# EasyEDA Pro project ProPrj_omb-2024-nano_2026-02-09.epro, schematic Schematic1_1
Create Date: 2024-06-04; Page Name: P1; Project Name: omb-2024-nano; Schematic Name: Schematic1_1; Update Date: 2024-06-10; Company: EasyEDA.com; Drawn: EasyEDA; Page Size: A4; Part Number: JLCPCB-002; Reviewed: EasyEDA; Version: V0.1
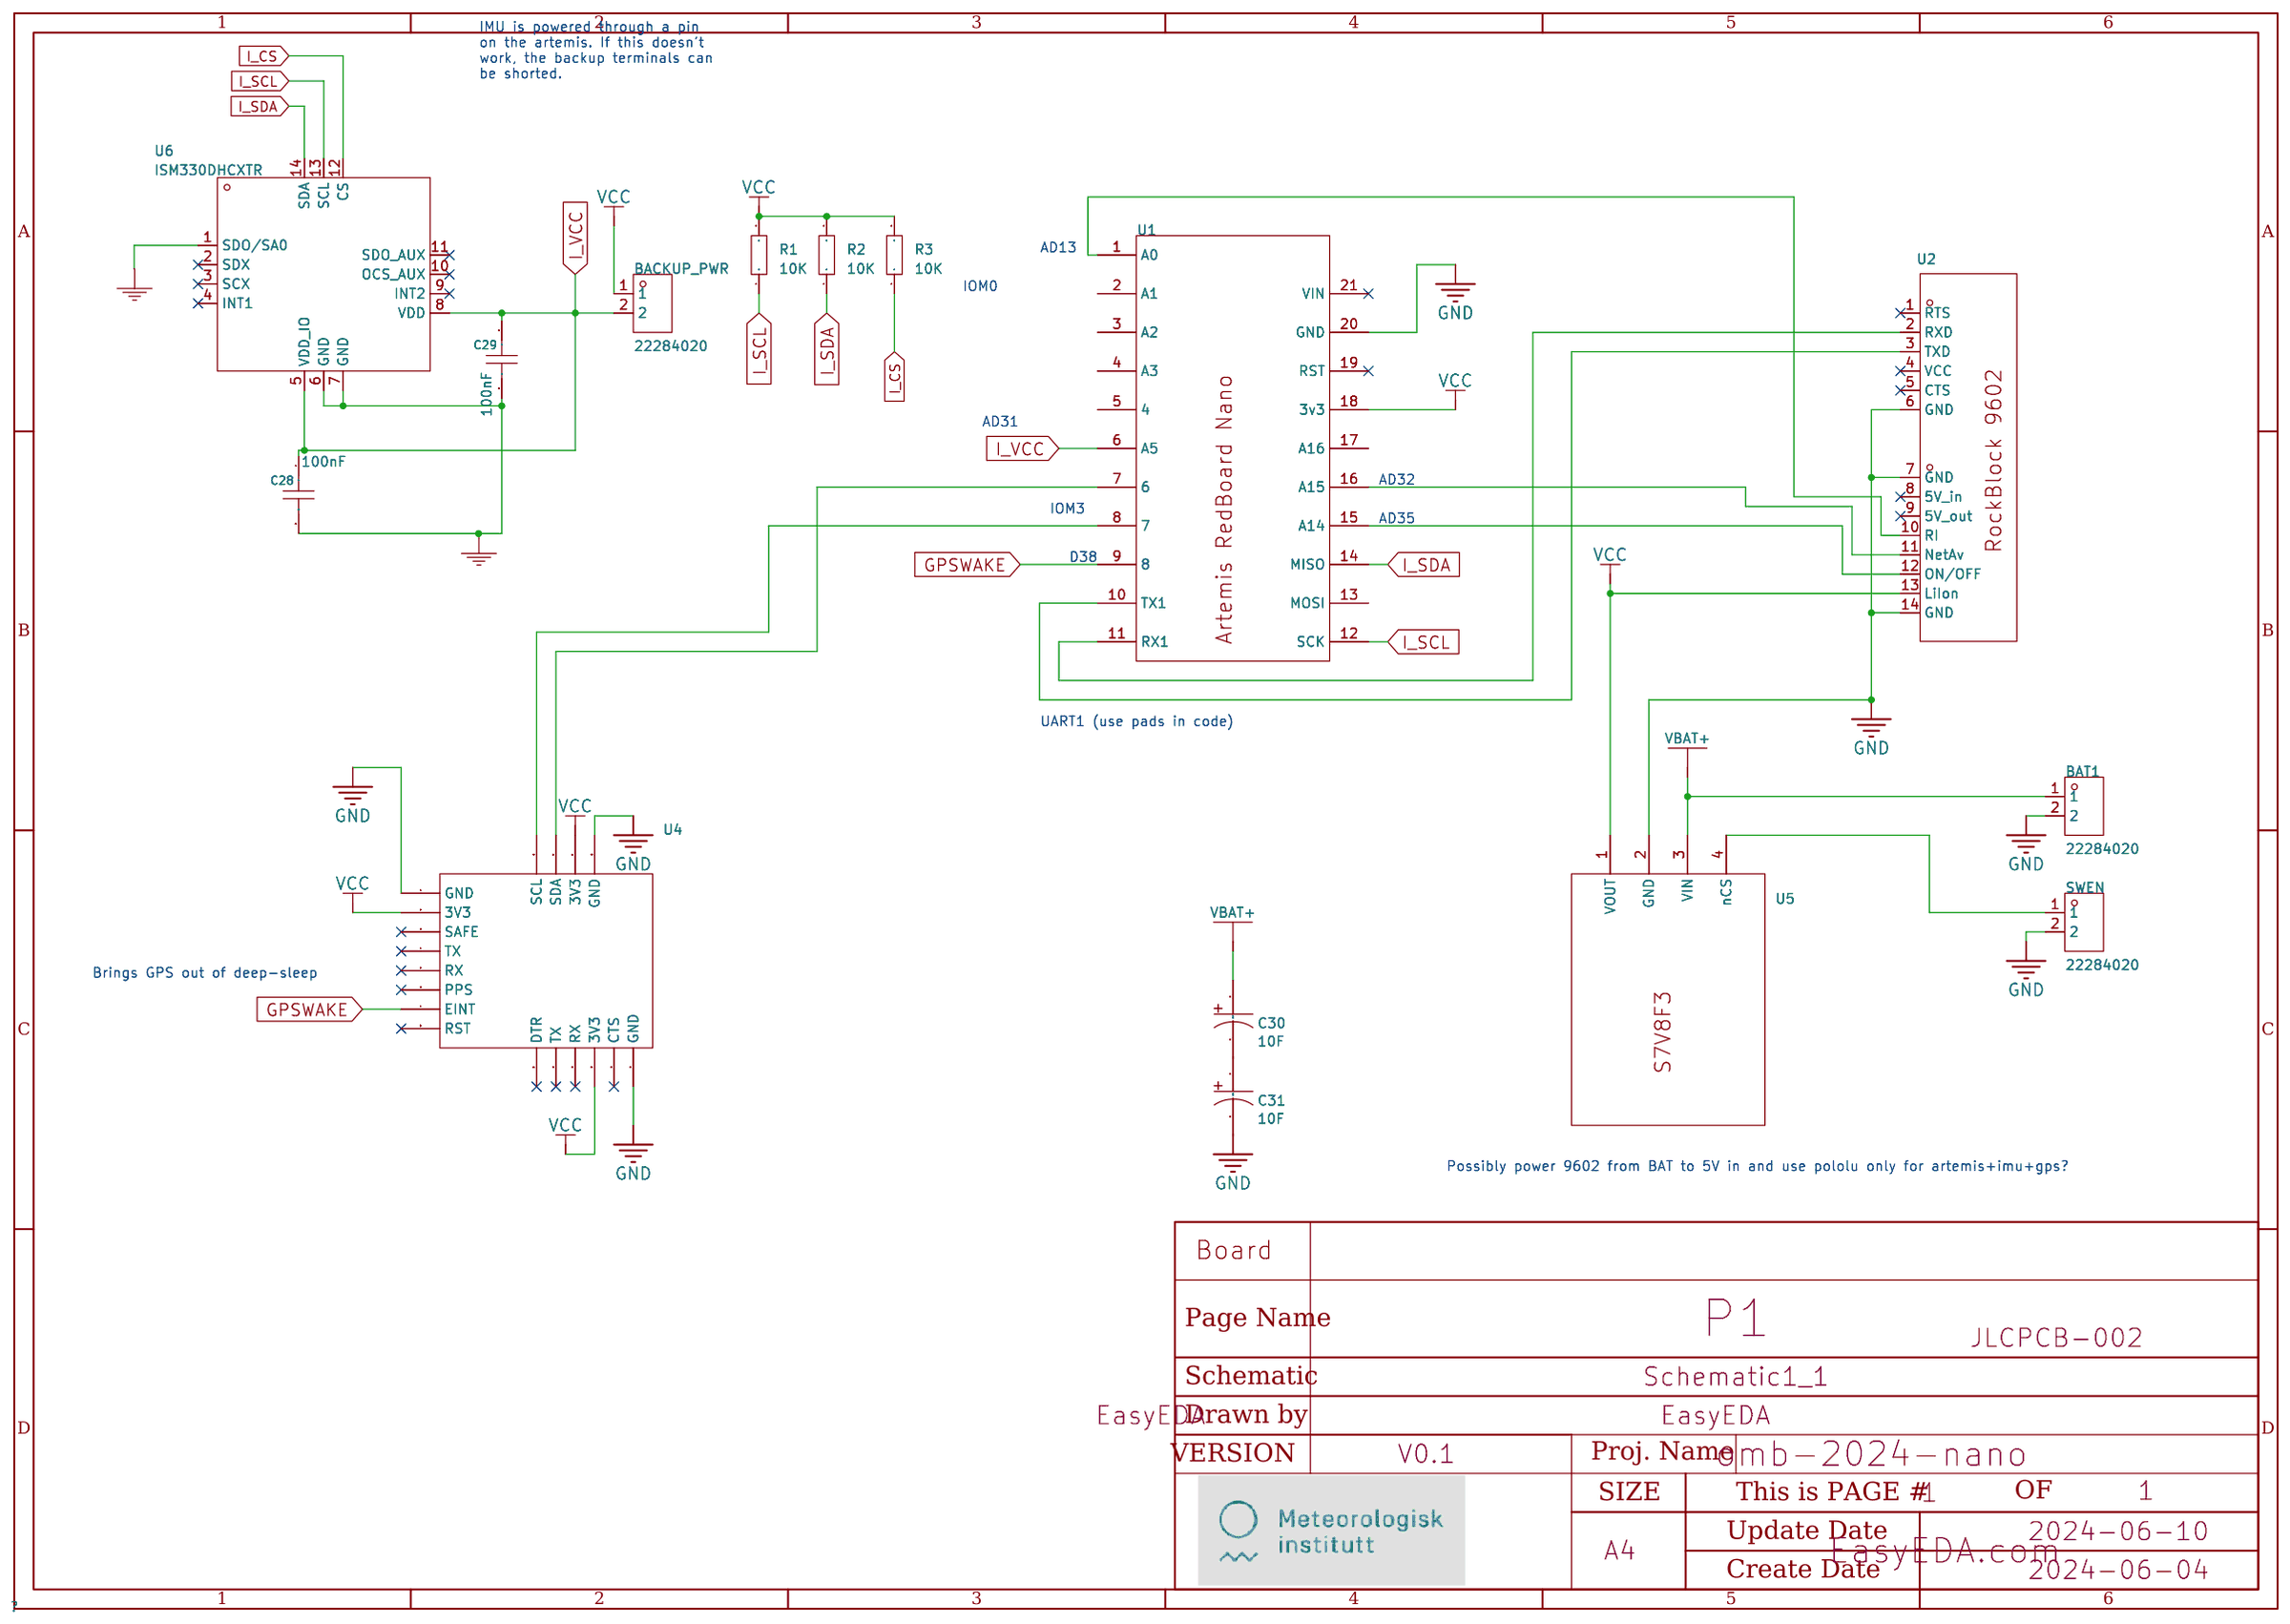
[diagram p1: schematic sheet]

## Parts
BACKUP_PWR  22284020  [HDR-TH_2P-P2.54-V-M-1]  (no BOM)
BAT1  22284020  [HDR-TH_2P-P2.54-V-M-1]  (no BOM)
C28  100nF  [C0402]
C29  100nF  [C0402]
C30  10F  [CP_12.5X20MM]  (no BOM)
C31  10F  [CP_12.5X20MM]  (no BOM)
R1  10K  [R0603]
R2  10K  [R0603]
R3  10K  [R0603]
SWEN  22284020  [HDR-TH_2P-P2.54-V-M-1]  (no BOM)
U1  -  [ARTEMIS REDBOARD NANO]
U2  -  [HDR-F-2.54_1X15]
U4  -  [SPARKFUN_U-BLOX_MAX-M10S]
U5  -  [S7V8F3]
U6  ISM330DHCXTR  [LGA-14_L3.0-W2.5-P0.50-BR]

## Library data of the parts
BACKUP_PWR BAT1 SWEN = 22284020: Pin Structure:1x2P Pitch:2.54mm Row Spacing:- Circluar Pins/Square Pins:Square Pins Mounting Type:Straight Number of Rows:Plugin Number of Pins:2P Current Rating (Max):- Voltage Rating (Max):- Length of Mating Pin:- Insulation Height:- Contact Material: C; LCSC Part Name: 间距:2.54mm 1x2P 直插 方针; Supplier Part: C234182; Manufacturer: MOLEX; Supplier Footprint: 插件,P=2.54mm; JLCPCB Part Class: Extended Part; Datasheet: https://atta.szlcsc.com/upload/public/pdf/source/20180801/C234182_F77B1C2A9EF8AC9B34CEB7670B45930E.pdf; Supplier: LCSC; Pin Structure: 1x2P; Pitch: 2.54mm; Circluar Pins/Square Pins: Square Pins; Mounting Type: Straight; Number of Rows: Plugin; Number of Pins: 2P; Color: Black
C28 C29 = CC0402KRX7R7BB104: Capacitance: Tolerance:±10% Tolerance:±10% Voltage Rated: Temperature Coefficient:; LCSC Part Name: 100nF ±10% 16V; Supplier Part: C60474; Manufacturer: YAGEO(国巨); Supplier Footprint: 0402; JLCPCB Part Class: Extended Part; Datasheet: https://atta.szlcsc.com/upload/public/pdf/source/20211223/9278FD768280B81DDBEF48FA36411A03.pdf; Supplier: LCSC; Tolerance: ±10%
C30 C31 = 10F: Supplier Part: 581-SCCT20B106PRB; Supplier: Mouser; Manufacturer: AVX; Manufacturer Part: SCCT20B106PRB; Link: https://www.mouser.com/datasheet/2/40/AVX-SCC-1018831.pdf
R1-R3 = Res_0603: Supplier Footprint: 0603
U1 = Artemis RedBoard Nano
U2 = Rockblock9602
U4 = sparkfun_u-blox_MAX-M10S
U5 = S7V8F3
U6 = ISM330DHCXTR: Supplier: LCSC; Supplier Part: C2655101; Manufacturer: ST(意法半导体); JLCPCB Part Class: Extended Part

## Nets
GND: BAT1.2 C28.2 C29.2 C31.2 SWEN.2 U1.20(GND) U2.6(GND) U2.7(GND) U2.14(GND) U4.1(GND) U4.14(GND) U4.18(GND) U5.2(GND) U6.1(SDO/SA0) U6.6(GND) U6.7(GND)
VBAT+: BAT1.1 C30.1 U5.3(VIN)
VCC: BACKUP_PWR.1 R1.2 R2.2 R3.2 U1.18(3v3) U2.13(LiIon) U4.2(3V3) U4.12(3V3) U4.17(3V3) U5.1(VOUT)
GPSWAKE: U1.9(8) U4.7(EINT)
I_CS: R3.1 U6.12(CS)
I_SCL: R1.1 U1.12(SCK) U6.13(SCL)
I_SDA: R2.1 U1.14(MISO) U6.14(SDA)
I_VCC: BACKUP_PWR.2 C28.1 C29.1 U1.6(A5) U6.5(VDD_IO) U6.8(VDD)
$1N1205: U1.15(A14) U2.12(ON/OFF)
$1N1212: U1.11(RX1) U2.2(RXD)
$1N1219: U1.10(TX1) U2.3(TXD)
$1N1474: U1.7(6) U4.16(SDA)
$1N1527: U1.8(7) U4.15(SCL)
$1N1582: U1.16(A15) U2.11(NetAv)
$1N1610: U1.1(A0) U2.10(RI)
$1N2154: SWEN.1 U5.4(nCS)
$1N2984: C30.2 C31.1

Not connected (* = marked no-connect by the designer): U1 2(A1) 3(A2) 4(A3) 5(4) 13(MOSI) 17(A16) 19(RST)* 21(VIN)*; U2 1(RTS)* 4(VCC)* 5(CTS)* 8(5V in)* 9(5V out)*; U4 3(SAFE)* 4(TX)* 5(RX)* 6(PPS)* 8(RST)* 9(DTR)* 10(TX)* 11(RX)* 13(CTS)*; U6 2(SDX)* 3(SCX)* 4(INT1)* 9(INT2)* 10(OCS_AUX)* 11(SDO_AUX)*

## Notes on the sheet
- IMU is powered through a pin
  on the artemis. If this doesn't
  work, the backup terminals can
  be shorted.
- AD13
- IOM0
- AD31
- AD32
- IOM3
- AD35
- D38
- UART1 (use pads in code)
- Brings GPS out of deep-sleep
- Possibly power 9602 from BAT to 5V in and use pololu only for artemis+imu+gps?
